# Altium schematic sheet RGB-LCD-Sheet.SchDoc
size 420 x 297 mm; SheetNumber: 3; SheetTotal: 5
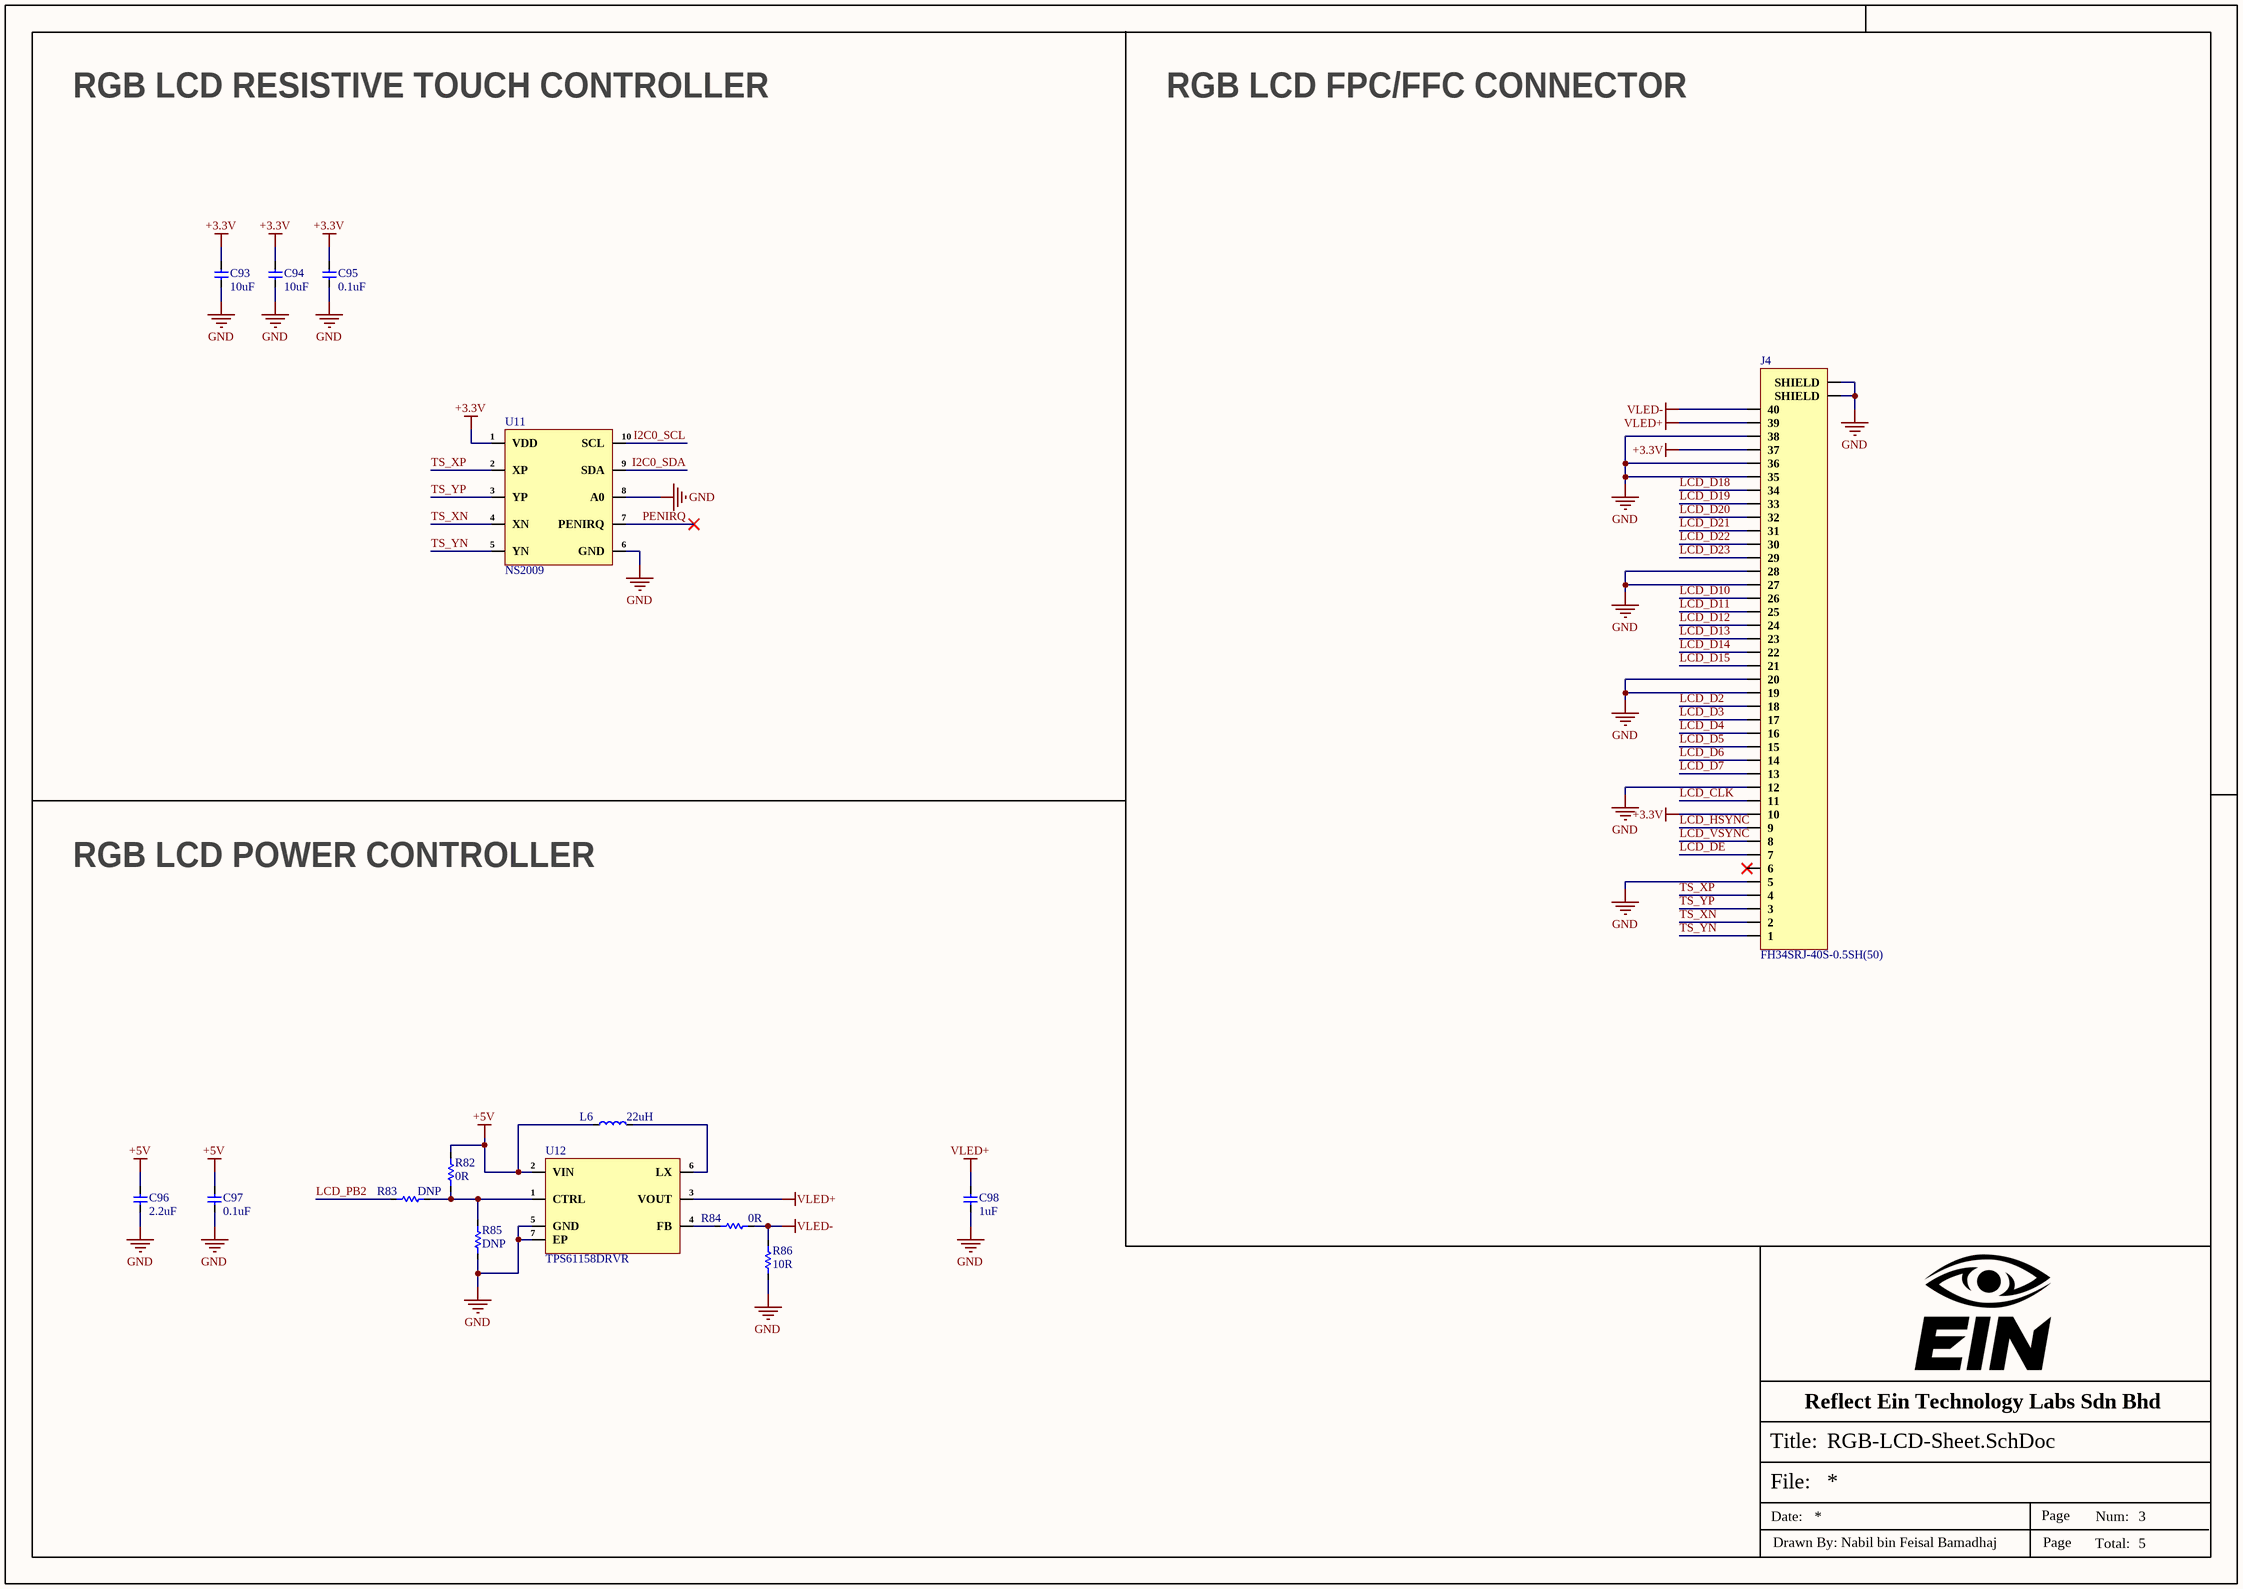
[diagram p0: RGB-LCD-Sheet.SchDoc]

## Parts
C93  10uF  [Cap-0603]
C94  10uF  [Cap-0603]
C95  0.1uF  [Cap-0402]
C96  2.2uF  [Cap-0603]
C97  0.1uF  [Cap-0402]
C98  1uF  [Cap-0603]
J4  FH34SRJ-40S-0.5SH(50)  [FH34SRJ-40S-0.5SH(50)]
L6  22uH  [YNR4018-220M]
R82  0R  [Res-0603]
R83  DNP  [Res-0603]
R84  0R  [Res-0603]
R85  DNP  [Res-0603]
R86  10R  [Res-0603]
U11  NS2009  [10-MSOP]
U12  TPS61158DRVR  [WSON-6-EP(2x2)]

## Nets
+3.3V: C93.2 C94.2 C95.2 J4.10 J4.37 U11.1(VDD)
+5V: C96.2 C97.2 L6.1 R82.2 U12.2(VIN)
GND: C93.1 C94.1 C95.1 C96.1 C97.1 C98.1 J4.5 J4.12 J4.19 J4.20 J4.27 J4.28 J4.35 J4.36 J4.38 J4.S1(SHIELD) J4.S2(SHIELD) R85.1 R86.1 U11.6(GND) U11.8(A0) U12.5(GND) U12.7(EP)
VLED+: C98.2 J4.39 U12.3(VOUT)
VLED-: J4.40 R84.2 R86.2
I2C0_SCL: U11.10(SCL)
I2C0_SDA: U11.9(SDA)
LCD_CLK: J4.11
LCD_D2: J4.18
LCD_D3: J4.17
LCD_D4: J4.16
LCD_D5: J4.15
LCD_D6: J4.14
LCD_D7: J4.13
LCD_D10: J4.26
LCD_D11: J4.25
LCD_D12: J4.24
LCD_D13: J4.23
LCD_D14: J4.22
LCD_D15: J4.21
LCD_D18: J4.34
LCD_D19: J4.33
LCD_D20: J4.32
LCD_D21: J4.31
LCD_D22: J4.30
LCD_D23: J4.29
LCD_DE: J4.7
LCD_HSYNC: J4.9
LCD_PB2: R83.1
LCD_VSYNC: J4.8
PENIRQ: U11.7(PENIRQ)
TS_XN: J4.2 U11.4(XN)
TS_XP: J4.4 U11.2(XP)
TS_YN: J4.1 U11.5(YN)
TS_YP: J4.3 U11.3(YP)
NetL6_2: L6.2 U12.6(LX)
NetR82_1: R82.1 R83.2 R85.2 U12.1(CTRL)
NetR84_1: R84.1 U12.4(FB)

Not connected (* = marked no-connect by the designer): J4 6*

## Notes on the sheet
- RGB LCD RESISTIVE TOUCH CONTROLLER
- RGB LCD FPC/FFC CONNECTOR
- RGB LCD POWER CONTROLLER
- Reflect Ein Technology Labs Sdn Bhd
- File:
- Title:
- Date:
- Page
- Num:
- Total:
- Drawn By: Nabil bin Feisal Bamadhaj

## Library data of the parts
C93 C94 = GRM188Z71A106KA73D: CAP CER 10UF 10V X7R 0603; Manufacturer: Murata; Item Type: Capacitor; Material: 4241ConductorMaterial; Tolerance: 10%; Supplier: Mouser; LCSC Part Number: C2959727; Manufacturer Part Number: GRM188Z71A106KA73D; RoHS: Yes; Stock: 390983; Pricing: 1=0.36, 10=0.155, 50=0.155, 100=0.104, 1000=0.094, 10000=0.065 (USD); Case/Package: 345Case; Min Operating Temperature: -55°C; Max Operating Temperature: 125°C; Value: 10uF; Voltage Rating: 10V; Length: 1.6mm; Width: 800um; Height: 1mm; Thickness: 800um; RoHS Compliant: Yes; ComponentLink1URL: https://datasheet.octopart.com/GRM188Z71A106KA73D-Murata-datasheet-165579666.pdf?src-supplier=TME; ComponentLink1Description: https://datasheet.octopart.com/GRM188Z71A106KA73D-Murata-datasheet-165579666.pdf?src-supplier=TME
C95 C97 = GRM155R71E104KE14D: CAP CER 0.1UF 25V X7R 0402; Manufacturer: Murata; Item Type: Capacitors; Dielectric Material: Ceramic; Material: 4241ConductorMaterial; Value: 100nF; Tolerance: 10%; Supplier: Mouser; LCSC Part Number: C77014; Manufacturer Part Number: GRM155R71E104KE14D; RoHS: Yes; Stock: 652368; Pricing: 1=0.1, 10=0.007, 50=0.007, 100=0.005, 1000=0.005, 10000=0.004 (USD); Mounting Technology: Surface Mount; Case/Package: 0402; Pins: 2NUMBER; Case Code (Metric): 1005; Case Code (Imperial): 0402; Weight: 0.000212oz; Min Operating Temperature: -55°C; Max Operating Temperature: 125°C; Packaging: Tape and Reel; Voltage Rating: 25V; Dielectric: X7R; Voltage: 25V; Termination: SMD/SMT; Voltage Rating (DC): 25V; Package Quantity: 10000; Series: GRM; Length: 1mm; Width: 0.02inch; Height: 0.5mm; Thickness: 0.022inch; Depth: 0.5mm; RoHS Compliant: Yes; Reach SVHC Compliant: Unknown; Lead Free: 5697LeadFree; ComponentLink1URL: http://www.farnell.com/datasheets/1872206.pdf?src-supplier=Farnell; ComponentLink1Description: http://www.farnell.com/datasheets/1872206.pdf?src-supplier=Farnell; ComponentLink2URL: http://www.mouser.com/ds/2/281/c02e-2905.pdf?src-supplier=Mouser; ComponentLink2Description: http://www.mouser.com/ds/2/281/c02e-2905.pdf?src-supplier=Mouser; ComponentLink3URL: http://uk.rs-online.com/webdocs/144c/0900766b8144c113.pdf?src-supplier=Rs; ComponentLink3Description: http://uk.rs-online.com/webdocs/144c/0900766b8144c113.pdf?src-supplier=Rs; ComponentLink4URL: https://datasheet.octopart.com/GRM155R71E104KE14D-Murata-datasheet-62346597.pdf?src-supplier=Future+Electronics; ComponentLink4Description: https://datasheet.octopart.com/GRM155R71E104KE14D-Murata-datasheet-62346597.pdf?src-supplier=Future+Electronics; ComponentLink5URL: https://search.murata.co.jp/Ceramy/image/img/A01X/G101/ENG/GRM155R71E104KE14-01.pdf?src-supplier=Digikey; ComponentLink5Description: https://search.murata.co.jp/Ceramy/image/img/A01X/G101/ENG/GRM155R71E104KE14-01.pdf?src-supplier=Digikey; ComponentLink6URL: http://www.farnell.com/datasheets/2048008.pdf?src-supplier=Newark; ComponentLink6Description: http://www.farnell.com/datasheets/2048008.pdf?src-supplier=Newark; ComponentLink7URL: https://datasheet.octopart.com/GRM155R71E104KE14D-Murata-datasheet-62317124.pdf?src-supplier=Element14; ComponentLink7Description: https://datasheet.octopart.com/GRM155R71E104KE14D-Murata-datasheet-62317124.pdf?src-supplier=Element14; ComponentLink8URL: http://psearch.en.murata.com/capacitor/product/GRM155R71E104KE14%23.pdf?src-supplier=Avnet; ComponentLink8Description: http://psearch.en.murata.com/capacitor/product/GRM155R71E104KE14%23.pdf?src-supplier=Avnet
C96 = CC0603KRX7R7BB225: CAP CER 2.2UF 16V X7R 0603; Manufacturer: Yageo; Item Type: Capacitors; Material: 4241ConductorMaterial; Dielectric: 1511DielectricType; Tolerance: 10%; Supplier: Future Electronics; LCSC Part Number: C914769; Manufacturer Part Number: CC0603KRX7R7BB225; RoHS: Yes; Stock: 100000; Pricing: 4000=0.0676, 8000=0.0665, 12000=0.0658, 16000=0.0654, 20000=0.0639 (USD); Mounting Technology: Surface Mount; Case/Package: 0603; Case Code (Imperial): 0603; Case Code (Metric): 1608; Min Operating Temperature: -55°C; Max Operating Temperature: 125°C; Series: CC; Packaging: Cut Tape; Voltage Rating: 16V; Voltage Rating (DC): 16V; Value: 2.2uF; Height: 900um; RoHS Compliant: Yes; Halogen Free: 5694HalogenFree; Lead Free: 5697LeadFree; ComponentLink1URL: https://datasheet.octopart.com/CC0603KRX7R7BB225-Yageo-datasheet-166511530.pdf?src-supplier=Future+Electronics; ComponentLink1Description: https://datasheet.octopart.com/CC0603KRX7R7BB225-Yageo-datasheet-166511530.pdf?src-supplier=Future+Electronics; ComponentLink2URL: http://www.yageo.com/documents/recent/UPY-GPHC_X7R_6.3V-to-50V_18.pdf?src-supplier=Digikey; ComponentLink2Description: http://www.yageo.com/documents/recent/UPY-GPHC_X7R_6.3V-to-50V_18.pdf?src-supplier=Digikey; ComponentLink3URL: https://datasheet.octopart.com/CC0603KRX7R7BB225-Yageo-datasheet-151948686.pdf?src-supplier=Farnell; ComponentLink3Description: https://datasheet.octopart.com/CC0603KRX7R7BB225-Yageo-datasheet-151948686.pdf?src-supplier=Farnell
C98 = CC0603KRX7R9BB105: CAP CER 1UF 50V X7R 0603; Manufacturer: Yageo; Item Type: Capacitors; Material: 4241ConductorMaterial; Tolerance: 10%; Supplier: Rs; LCSC Part Number: C559769; Manufacturer Part Number: CC0603KRX7R9BB105; RoHS: Yes; Stock: 950; Mounting Technology: Surface Mount; Case/Package: 0603; Case Code (Metric): 1608; Case Code (Imperial): 0603; Weight: 7.1E-05oz; Min Operating Temperature: -55°C; Max Operating Temperature: 125°C; Value: 1uF; Dielectric: X7R; Packaging: Tape and Reel; Voltage Rating: 50V; Termination: SMD/SMT; Voltage Rating (DC): 50V; Package Quantity: 4000; Series: CC; Length: 0.063inch; Width: 0.031inch; Height: 900um; Thickness: 0.035inch; Lead Free: Lead Free; RoHS Compliant: Yes; Halogen Free: 5694HalogenFree; ComponentLink1URL: http://www.mouser.com/ds/2/447/Yageo_UPY-GP_NP0_16V-to-50V_9-358835.pdf?src-supplier=Mouser; ComponentLink1Description: http://www.mouser.com/ds/2/447/Yageo_UPY-GP_NP0_16V-to-50V_9-358835.pdf?src-supplier=Mouser; ComponentLink2URL: http://www.yageo.com/documents/recent/UPY-GPHC_X7R_6.3V-to-50V_18.pdf?src-supplier=Digikey; ComponentLink2Description: http://www.yageo.com/documents/recent/UPY-GPHC_X7R_6.3V-to-50V_18.pdf?src-supplier=Digikey; ComponentLink3URL: https://datasheet.octopart.com/CC0603KRX7R9BB105-Yageo-datasheet-137700082.pdf?src-supplier=Future+Electronics; ComponentLink3Description: https://datasheet.octopart.com/CC0603KRX7R9BB105-Yageo-datasheet-137700082.pdf?src-supplier=Future+Electronics
J4 = FH34SRJ-40S-0.5SH(50): CONN FFC FPC 40POS 0.5MM R/A; Manufacturer: Hirose; Item Type: FFC / FPC Connector; Actuator Material: Nylon,Polyamide; Actuator Color: Black; Number of Positions: 40; Voltage Rating: 50V; Current Rating: 500mA; Mating Cycles: 20; Pitch: 0.02inch; Supplier: Digikey; LCSC Part Number: C506798; Manufacturer Part Number: FH34SRJ-40S-0.5SH(50); RoHS: Yes; Stock: 2275; Pricing: 1=1.39, 10=1.129, 25=1.0408, 50=0.9788, 100=0.9203, 250=0.84848, 500=0.7979, 1000=0.75036, 2500=0.69185 (USD); Mounting Technology: Surface Mount; Pins: 40; Contact Material: Bronze; Contact Plating: Gold; Housing Material: Polymer; Housing Color: Grey; Min Operating Temperature: -55°C; Max Operating Temperature: 85°C; Packaging: Tape and Reel; Termination: Solder; Series: FH34SRJ; Flammability Rating: UL94 V-0; Lead Free: Lead Free; RoHS Compliant: Yes; ComponentLink1URL: https://datasheet.octopart.com/FH34SRJ-40S-0.5SH%2850%29-Hirose-datasheet-136412957.pdf?src-supplier=Future+Electronics; ComponentLink1Description: https://datasheet.octopart.com/FH34SRJ-40S-0.5SH%2850%29-Hirose-datasheet-136412957.pdf?src-supplier=Future+Electronics; ComponentLink2URL: https://www.hirose.com/product/download/?distributor=digikey&amp;type=2d&amp;lang=en&amp;num=FH34SRJ-40S-0.5SH(50)&src-supplier=Digikey; ComponentLink2Description: https://www.hirose.com/product/download/?distributor=digikey&amp;type=2d&amp;lang=en&amp;num=FH34SRJ-40S-0.5SH(50)&src-supplier=Digikey; ComponentLink3URL: https://www.hirose.com/product/document?clcode=CL0580-1251-5-99&amp;productname=FH34SRJ-10S-0.5SH(99)&amp;series=FH34SRJ&amp;documenttype=Catalog&amp;lang=en&amp;documentid=D31646_en&src-supplier=Digikey; ComponentLink3Description: https://www.hirose.com/product/document?clcode=CL0580-1251-5-99&amp;productname=FH34SRJ-10S-0.5SH(99)&amp;series=FH34SRJ&amp;documenttype=Catalog&amp;lang=en&amp;documentid=D31646_en&src-supplier=Digikey
L6 = YNR4018-220M: 590mA 22uH ±20% SMD,4x4x1.8mm Power Inductors ROHS; Manufacturer: YJYCOIN; Manufacturer Part Number: YNR4018-220M; Package: SMD,4x4x1.8mm; LCSC Part Number: C340373; Item Type: Inductor; ComponentLink1Description: LCSC; ComponentLink1URL: https://www.lcsc.com/product-detail/Power-Inductors_YJYCOIN-YNR4018-220M_C340373.html
R82-R84 = RC0603FR-070RL: RES SMD 0R, 1%, 0.1W, 0603; Manufacturer: Yageo; Item Type: Resistor; Manufacturer Part Number: RC0603FR-070RL; Package: 0603; LCSC Part Number: C100044; ComponentLink9Description: LCSC; ComponentLink9URL: https://www.lcsc.com/product-detail/Chip-Resistor-Surface-Mount_YAGEO-RC0603FR-070RL_C100044.html
R85 = RC0603FR-0710KL: RES SMD 10K Ohm 1% 1/10W 0603; Manufacturer: Yageo; Resistance: 10kR; Temperature Coefficient: 100ppm/°C; Voltage Rating (DC): 50V; Power Rating: 100mW; Voltage Rating: 75V; Item Type: Resistor; Supplier 1: Digi-Key; Manufacturer Part Number: RC0603FR-0710KL; RoHS: Yes; Category: Chip SMD Resistors; Stock 1: 25249139; Pricing 1: 1=0.10000, 10=0.02400, 100=0.00970, 1000=0.00436, 2500=0.00378 (USD); Case/Package: 0603; Number of Pins: 2; Case Code (Imperial): 0603; Case Code (Metric): 1608; Weight: 7.1E-05oz; Size Code: 0603; Min Operating Temperature: -55°C; Max Operating Temperature: 155°C; Tolerance: 1%; Resistor Type: Thick Film; Packaging: Tape and Reel; Termination: SMD/SMT; Features: Moisture Resistant; Series: RC; Max Power Dissipation: 100mW; Number of Terminations: 2; Resistance Tolerance: 1%; Construction: Rectangular; Length: 1.6mm; Width: 0.8mm; Height: 0.45mm; Depth: 0.8mm; Lead Pitch: 0.3mm; REACH SVHC: Unknown; Lead Free: Lead Free; Military Standard: Not; RoHS Compliant: Yes; ComponentLink1URL: https://datasheet.ciiva.com/7660/38590-7660789.pdf?src-supplier=Element14; ComponentLink1Description: https://datasheet.ciiva.com/7660/38590-7660789.pdf?src-supplier=Element14; ComponentLink2URL: https://datasheet.ciiva.com/7983/443971-7983596.pdf?src-supplier=Element14; ComponentLink2Description: https://datasheet.ciiva.com/7983/443971-7983596.pdf?src-supplier=Element14; ComponentLink3URL: https://datasheet.ciiva.com/22747/443971-22747519.pdf?src-supplier=Element14; ComponentLink3Description: https://datasheet.ciiva.com/22747/443971-22747519.pdf?src-supplier=Element14; ComponentLink4URL: https://datasheet.ciiva.com/46440/1868787-46440891.pdf?src-supplier=Element14; ComponentLink4Description: https://datasheet.ciiva.com/46440/1868787-46440891.pdf?src-supplier=Element14; ComponentLink5URL: https://datasheet.ciiva.com/7746/1738695-7746239.pdf?src-supplier=Element14; ComponentLink5Description: https://datasheet.ciiva.com/7746/1738695-7746239.pdf?src-supplier=Element14; ComponentLink6URL: https://datasheet.ciiva.com/15189/getdatasheetpartid-409289-15189591.pdf?src-supplier=Verical; ComponentLink6Description: https://datasheet.ciiva.com/15189/getdatasheetpartid-409289-15189591.pdf?src-supplier=Verical; Supplier Part Number 1: 311-10.0KHRCT-ND; LCSC Part Number: C98220
R86 = RC0603FR-0710RL: RES SMD 10 OHM 1% 1/10W 0603; Manufacturer: Yageo; Temperature Coefficient: 200ppm/°C; Power Rating: 100mW; Voltage Rating: 50V; Item type: Resistor; Supplier 1: Digi-Key; Manufacturer Part Number: RC0603FR-0710RL; Stock 1: 10836596; Pricing 1: 1=0.1, 10=0.046, 100=0.0187, 1000=0.0084, 2500=0.00729 (USD); Case/Package: 0603; Number of Pins: 2; Case Code (Imperial): 0603; Case Code (Metric): 1608; Contact Plating: Tin,Matte; Min Operating Temperature: -55°C; Max Operating Temperature: 155°C; Resistance: 10R; Tolerance: 1%; Composition: Thick Film; Packaging: Tape and Reel; Voltage Rating (DC): 50V; Termination: SMD/SMT; Military Standard: Not; Length: 1.6mm; Height: 0.45mm; Width: 0.8mm; Depth: 0.8mm; Radiation Hardening: No; Lead Free: Lead Free; REACH SVHC: No SVHC; ComponentLink1URL: http://www.farnell.com/datasheets/1868787.pdf?src-supplier=Element14; ComponentLink1Description: http://www.farnell.com/datasheets/1868787.pdf?src-supplier=Element14; ComponentLink2URL: http://www.yageo.com/documents/recent/PYu-RC0603_51_RoHS_L_4.pdf?src-supplier=Avnet; ComponentLink2Description: http://www.yageo.com/documents/recent/PYu-RC0603_51_RoHS_L_4.pdf?src-supplier=Avnet; ComponentLink3URL: http://documents.rs-components.com/techlib://itc_doclist_GB.htm?stockno=5048984&src-supplier=RSComponents; ComponentLink3Description: http://documents.rs-components.com/techlib://itc_doclist_GB.htm?stockno=5048984&src-supplier=RSComponents; ComponentLink4URL: http://www.yageo.com/documents/recent/PYu-RC0603_51_RoHS_L_4.pdf?src-supplier=Avnet+Europe; ComponentLink4Description: http://www.yageo.com/documents/recent/PYu-RC0603_51_RoHS_L_4.pdf?src-supplier=Avnet+Europe; Supplier Part Number 1: 311-10.0HRDKR-ND; LCSC Part Number: C109318
U11 = NS2009: MSOP-10 Touch Screen Controllers ROHS; Manufacturer: Shenzhen Nsiway Tech; Item Type: IC; Manufacturer Part Number: NS2009; Package: MSOP-10; LCSC Part Number: C219024; ComponentLink1Description: LCSC; ComponentLink1URL: https://www.lcsc.com/product-detail/Touch-Screen-Controllers_Shenzhen-Nsiway-Tech-NS2009_C219024.html?s_z=n_NS2009
U12 = TPS61158DRVR: IC LED DRVR RGLTR PWM 30MA 6WSON; Manufacturer: Texas Instruments; Supplier: Mouser; LCSC Part Number: C702280; Manufacturer Part Number: TPS61158DRVR; RoHS: Yes; Item Type: IC; Stock: 6942; Pricing: 1=0.81, 10=0.594, 50=0.594, 100=0.489, 1000=0.446, 10000=0.4 (USD); ComponentLink1URL: https://datasheet.ciiva.com/26932/getdatasheetpartid-782062-26932814.pdf?src-supplier=Verical; ComponentLink1Description: https://datasheet.ciiva.com/26932/getdatasheetpartid-782062-26932814.pdf?src-supplier=Verical; ComponentLink2URL: https://datasheet.ciiva.com/24016/slvsbr3-261171-24016309.pdf?src-supplier=Mouser; ComponentLink2Description: https://datasheet.ciiva.com/24016/slvsbr3-261171-24016309.pdf?src-supplier=Mouser; ComponentLink3URL: https://datasheet.ciiva.com/18569/tps61158-18569084.pdf?src-supplier=Digikey; ComponentLink3Description: https://datasheet.ciiva.com/18569/tps61158-18569084.pdf?src-supplier=Digikey